# EasyEDA Pro project usb_before_capacitor_short_repair.epro

# Schematic Schematic1
Board Name: Board1; Create Date: 2026-10-12; Page Name: P1; Project Name: BEEBOX; Schematic Name: Schematic1; Update Date: 2026-10-13; Company: BeeBox; Page Size: A0; Version: DRAFT
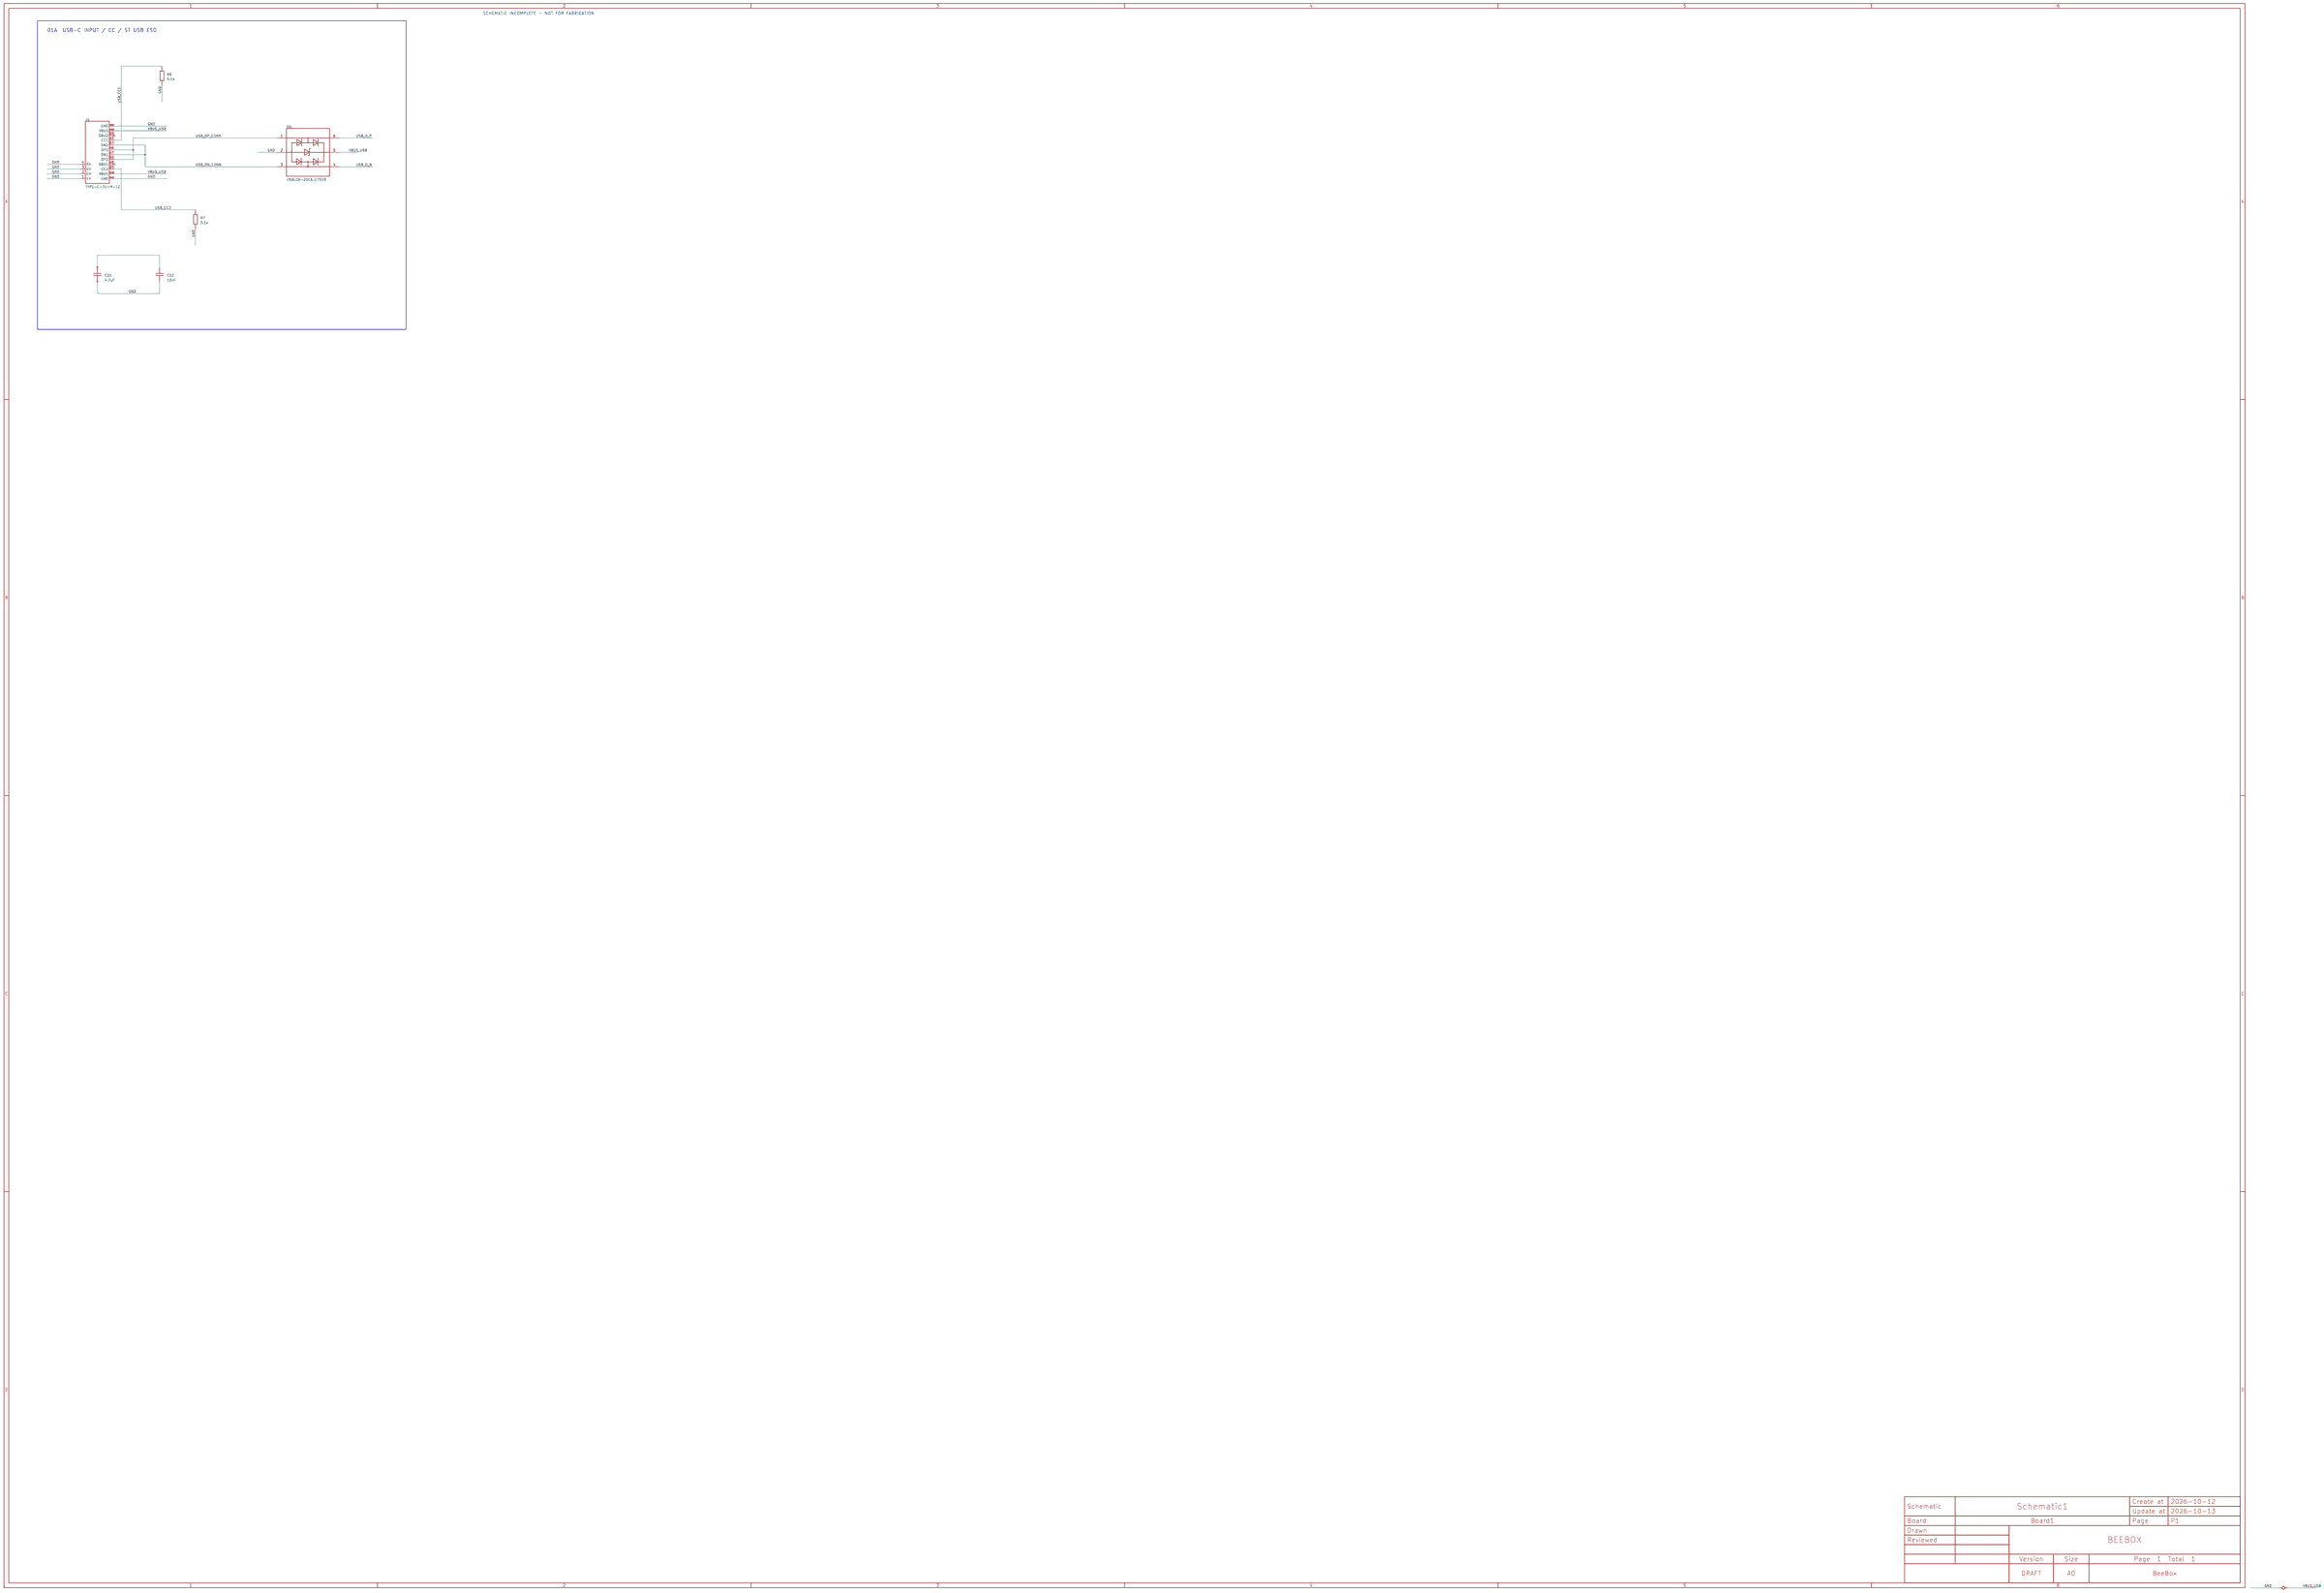
[diagram p0: schematic sheet]

## Parts
C21  4.7uF  [C0805]
C22  10nF  [C0603]
D6  USBLC6-2SC6_C7519  [SOT-23-6_L2.9-W1.6-P0.95-LS2.8-BL]
J1  TYPE-C-31-M-12  [USB-C_SMD-TYPE-C-31-M-12_1]
R6  5.1kΩ  [R0603]
R7  5.1kΩ  [R0603]

## Library data of the parts
C21 = CL21B475KOFNNNE: Capacitance:4.7uF Tolerance:±10% Tolerance:±10% Voltage Rating:16V Temperature Coefficient:X7R; LCSC Part Name: 4.7uF ±10% 16V; Supplier Part: C107365; Manufacturer: SAMSUNG(三星); Supplier Footprint: 0805; JLCPCB Part Class: Extended Part; Datasheet: https://item.szlcsc.com/datasheet/CL21B475KOFNNNE/108584.html; Supplier: LCSC; Tolerance: ±10%; Voltage Rating: 16V; Temperature Coefficient: X7R; Package: 0805
C22 = CL10B103KB8NNNC: Capacitance:10nF Tolerance:±10% Tolerance:±10% Voltage Rating:50V Temperature Coefficient:X7R; LCSC Part Name: 10nF ±10% 50V; Supplier Part: C1589; Manufacturer: SAMSUNG(三星); Supplier Footprint: 0603; JLCPCB Part Class: Extended Part; Datasheet: https://item.szlcsc.com/datasheet/CL10B103KB8NNNC/1941.html; Supplier: LCSC; Tolerance: ±10%; Voltage Rating: 50V; Temperature Coefficient: X7R; Package: 0603
D6 = USBLC6-2SC6_C7519: Polarity:Unidirectional Reverse Stand-Off Voltage (Vrwm):5.25V Clamping Voltage:17V Peak Pulse Current (Ipp):5A Voltage - Breakdown:6V Reverse Leakage Current (Ir):150nA Number of Channels:2 Operating Temperature:-40℃~+125℃ Operating Temperature:-40℃~+125; LCSC Part Name: 单向ESD 5.25V截止 峰值脉冲电流：5A; Supplier Part: C7519; Manufacturer: ST(意法半导体); Manufacturer Part: USBLC6-2SC6; Supplier Footprint: SOT-23-6L; JLCPCB Part Class: Extended Part; Datasheet: https://item.szlcsc.com/datasheet/USBLC6-2SC6/7996.html; Supplier: LCSC; Polarity: Unidirectional; Reverse Stand-Off Voltage (Vrwm): 5.25V; Clamping Voltage: 17V; Peak Pulse Current (Ipp): 5A; Voltage - Breakdown: 6V; Reverse Leakage Current (Ir): 150nA; Number of Channels: 2; Operating Temperature: -40℃~+125℃; level of protection: IEC 61000-4-2; Type: ESD; Junction Capacitance: 3.5pF; Package: SOT-23-6L
J1 = TYPE-C-31-M-12: Connector Type:Type-C Protocol Standard:- Gender:Female Mounting Type:Surface Mount, Right Angle Number of Contacts:16P Number of Ports:1 Current Rating-Power:5A Voltage Rating:20V Connect-Disconnect Life:10,000 cycles Length:7.35mm Operating Temperature:; LCSC Part Name: Type-C 母 卧贴; Supplier Part: C165948; Manufacturer: 韩国韩荣; Supplier Footprint: SMD; JLCPCB Part Class: Extended Part; Datasheet: https://item.szlcsc.com/datasheet/TYPE-C-31-M-12/177331.html; Supplier: LCSC; Connector Type: Type-C; Gender: Female; Mounting Type: Surface Mount, Right Angle; Number of Contacts: 16P; Number of Ports: 1; Current Rating-Power: 5A; Voltage Rating: 20V; Connect-Disconnect Life: 10,000 cycles; Length: 7.35mm; Operating Temperature: -30℃~+80℃; Package: SMD
R6 R7 = 0603WAF5101T5E: Type:Thick Film Resistor Resistance:5.1kΩ Tolerance:±1% Tolerance:±1% Power(Watts):100mW Voltage-Supply(Max):75V Temperature Coefficient:±100ppm/℃ Temperature Coefficient:±100ppm/℃ Operating Temperature:-55℃~+155℃ Operating Temperature:-55℃~+155℃; LCSC Part Name: 厚膜电阻 5.1kΩ ±1%; Supplier Part: C23186; Manufacturer: UNI-ROYAL(厚声); Supplier Footprint: 0603; JLCPCB Part Class: Basic Part; Datasheet: https://item.szlcsc.com/datasheet/0603WAF5101T5E/23913.html; Supplier: LCSC; Type: Thick Film Resistor; Tolerance: ±1%; Power(Watts): 100mW; Voltage-Supply(Max): 75V; Temperature Coefficient: ±100ppm/℃; Operating Temperature: -55℃~+155℃; Package: 0603

## Nets
GND: C21.1 C21.2 C22.1 C22.2 D6.2 D6.5 J1.1(EH) J1.2(EH) J1.3(EH) J1.4(EH) J1.A1B12(GND) J1.A4B9(VBUS) J1.B1A12(GND) J1.B4A9(VBUS) R6.2 R7.2
USB_CC1: J1.A5(CC1) R6.1
USB_CC2: J1.B5(CC2) R7.1
USB_D_N: D6.4
USB_D_P: D6.6
USB_DN_CONN: D6.3 J1.A7(DN1) J1.B7(DN2)
USB_DP_CONN: D6.1 J1.A6(DP1) J1.B6(DP2)

Not connected (* = marked no-connect by the designer): J1 A8(SBU1)* B8(SBU2)*

## Notes on the sheet
- SCHEMATIC INCOMPLETE - NOT FOR FABRICATION
- 01A  USB-C INPUT / CC / ST USB ESD
- 01A  USB-C INPUT / CC / ST USB ESD
